# Altium schematic sheet Assembly.SchDoc
size 173 x 110 mm
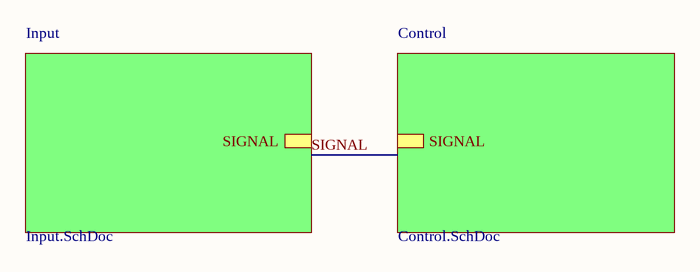
[diagram p0: Assembly.SchDoc]

## Sub-sheets
Control = Control.SchDoc: SIGNAL
Input = Input.SchDoc: SIGNAL